# Altium schematic sheet ec200u.SchDoc
size 635 x 398 mm; SheetNumber: 3; SheetTotal: 5
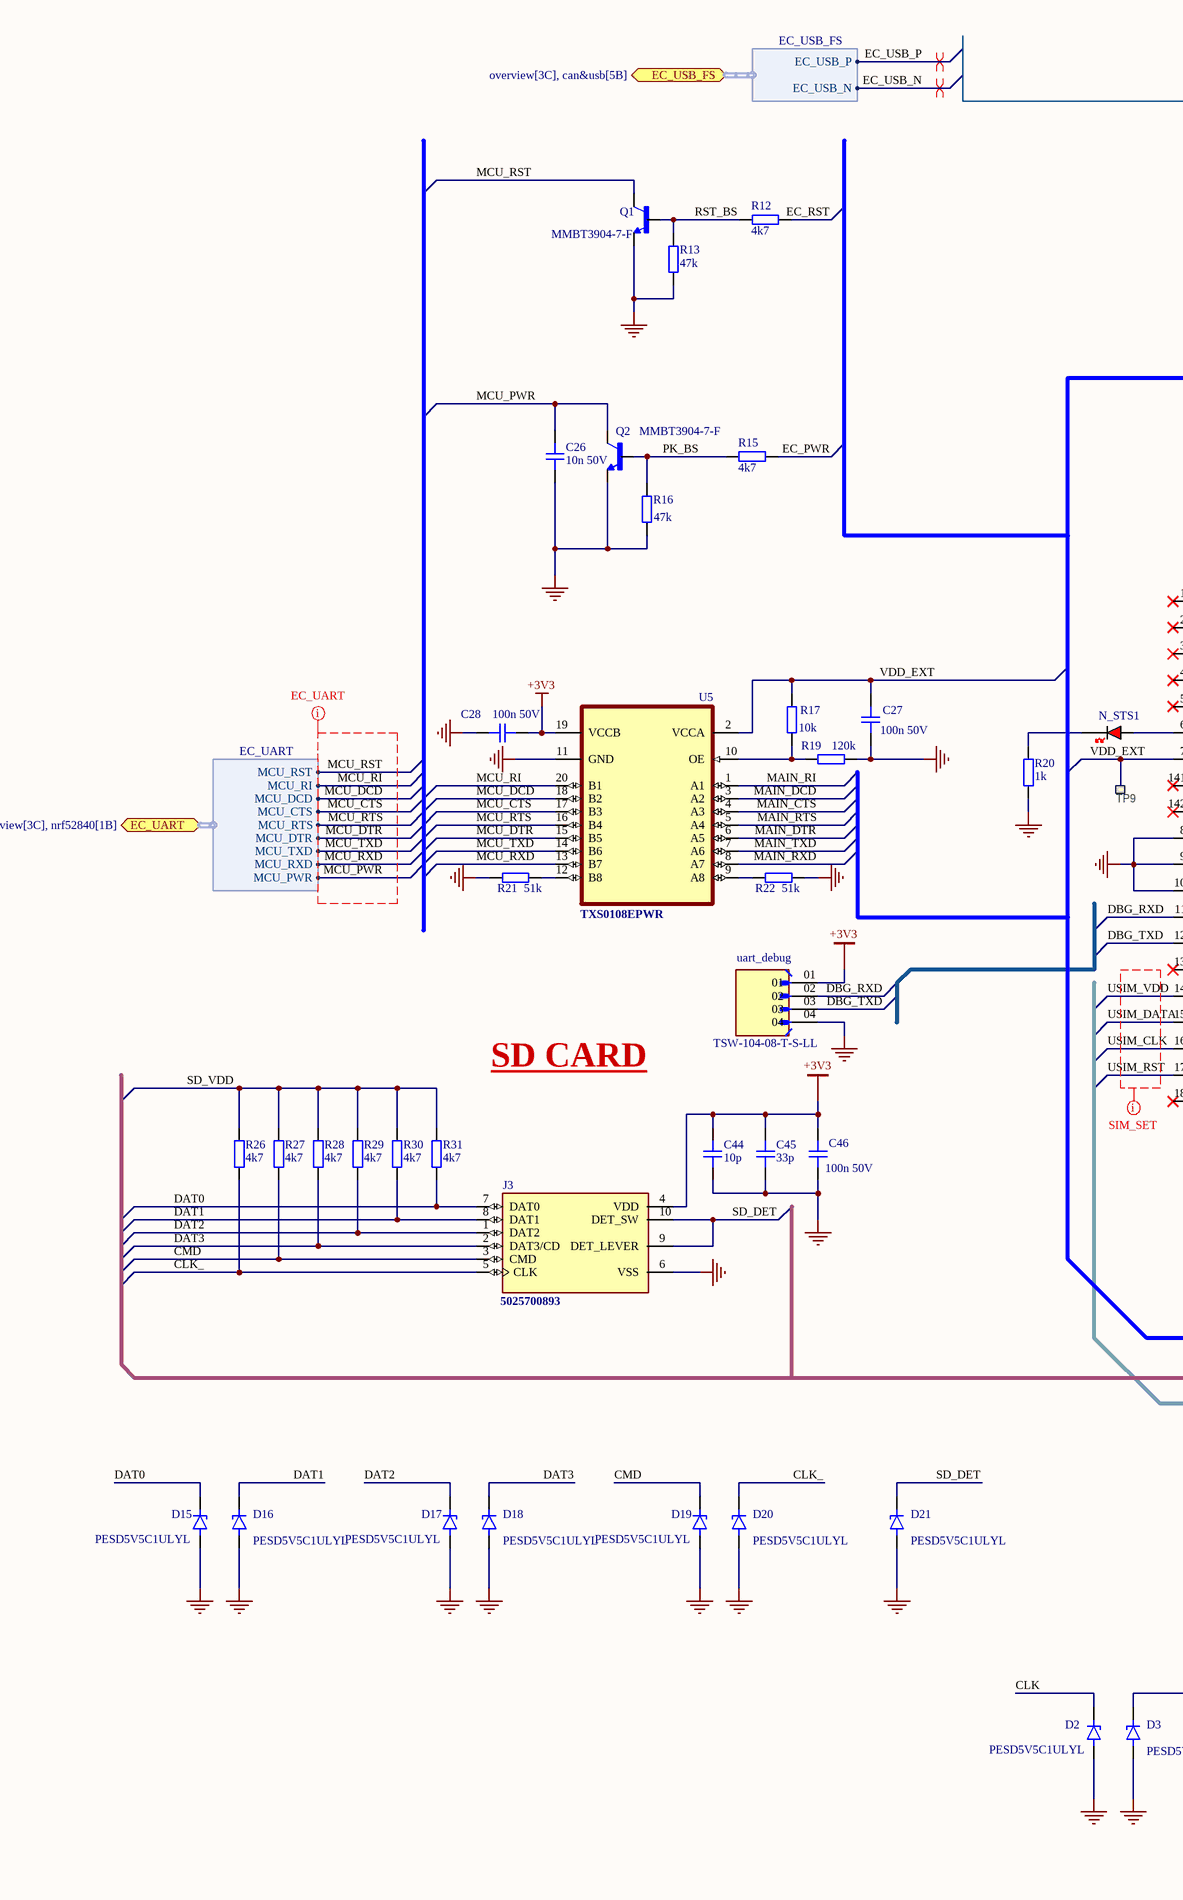
[diagram p0: ec200u.SchDoc, left]
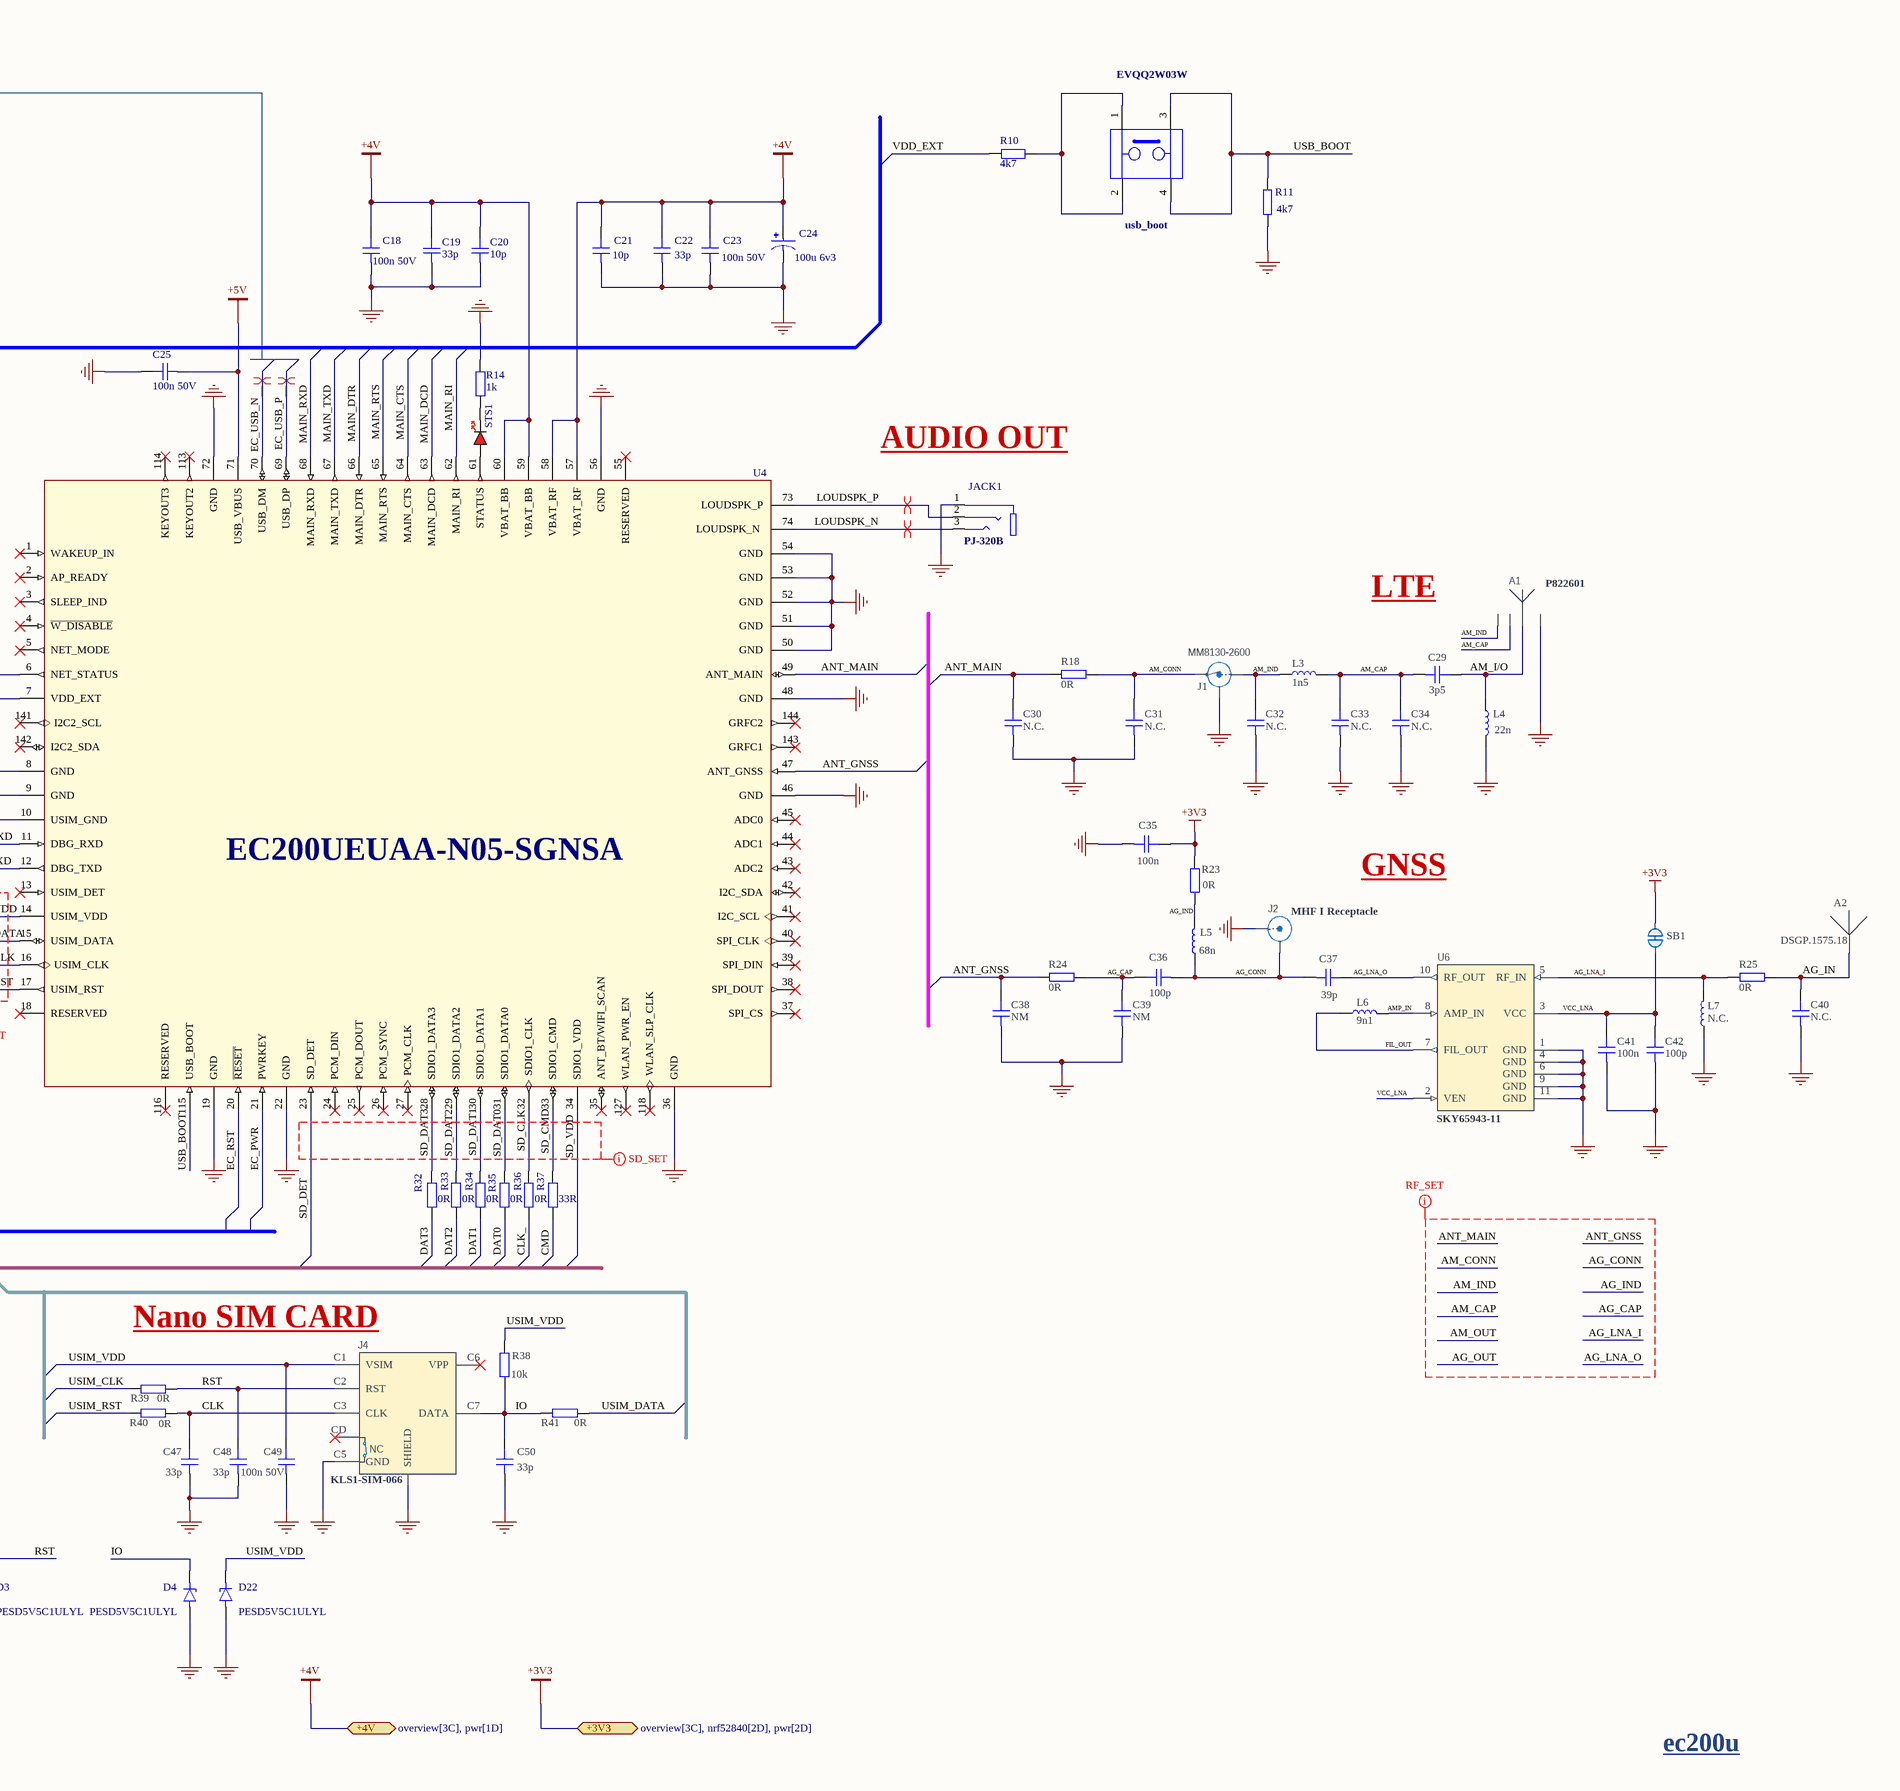
[diagram p1: ec200u.SchDoc, right]

## Parts
A1  P822601  [P822601]
A2  DSGP.1575.18  [DSGP.1575.18.4.C.02]
C18  100n 50V  [CAP_0402]
C19  33p  [CAP_0402]
C20  10p  [CAP_0402]
C21  10p  [CAP_0402]
C22  33p  [CAP_0402]
C23  100n 50V  [CAP_0402]
C24  100u 6v3  [CAP_EEEHA0J101WR]
C25  100n 50V  [CAP_0402]
C26  10n 50V  [CAP_0603]
C27  100n 50V  [CAP_0402]
C28  100n 50V  [CAP_0402]
C29  3p5  [CAPC0603X03L_C]
C30  N.C.  [CAPC1005X04L_NC]
C31  N.C.  [CAPC1005X04L_NC]
C32  N.C.  [CAPC0603X03L_C_NC]
C33  N.C.  [CAPC0603X03L_C_NC]
C34  N.C.  [CAPC0603X03L_C_NC]
C35  100n  [CAPC1005X04L]
C36  100p  [CAPC1005X04L]
C37  39p  [CAPC0603X03L_C]
C38  NM  [CAPC1005X04L]
C39  NM  [CAPC1005X04L]
C40  N.C.  [CAPC1005X04L_NC]
C41  100n  [CAPC1005X04L]
C42  100p  [CAPC1005X04L]
C44  10p  [CAP_0402]
C45  33p  [CAP_0402]
C46  100n 50V  [CAP_0402]
C47  33p  [CAPC1005X04L]
C48  33p  [CAPC1005X04L]
C49  100n 50V  [CAPC1005X04L]
C50  33p  [CAPC1005X04L]
D2  PESD5V5C1ULYL  [DIO_PESD5V5C1ULYL]
D3  PESD5V5C1ULYL  [DIO_PESD5V5C1ULYL]
D4  PESD5V5C1ULYL  [DIO_PESD5V5C1ULYL]
D15  PESD5V5C1ULYL  [DIO_PESD5V5C1ULYL]
D16  PESD5V5C1ULYL  [DIO_PESD5V5C1ULYL]
D17  PESD5V5C1ULYL  [DIO_PESD5V5C1ULYL]
D18  PESD5V5C1ULYL  [DIO_PESD5V5C1ULYL]
D19  PESD5V5C1ULYL  [DIO_PESD5V5C1ULYL]
D20  PESD5V5C1ULYL  [DIO_PESD5V5C1ULYL]
D21  PESD5V5C1ULYL  [DIO_PESD5V5C1ULYL]
D22  PESD5V5C1ULYL  [DIO_PESD5V5C1ULYL]
J1  MM8130-2600  [COAXIAL-SWF]
J2  MHF I Receptacle  [COAXIAL RF U.FL-R-SMT-1]
J3  5025700893  [MOLEX_5025700893]
J4  KLS1-SIM-066  [KLS1-SIM-066]
JACK1  PJ-320B  [BOOMELE_PJ-320B]
L3  1n5  [INDC0603X03L_C]
L4  22n  [INDC0603X03L_C]
L5  68n  [INDC1005X04L_WW]
L6  9n1  [INDC1005X04L_WW]
L7  N.C.  [INDC1005X04L_NC]
N_STS1  RED  [LED_0603_RED]  (value not drawn)
Q1  MMBT3904-7-F  [SOT95P230X110-3N]
Q2  MMBT3904-7-F  [SOT95P230X110-3N]
R10  4k7  [RES_0603]
R11  4k7  [RES_0603]
R12  4k7  [RES_0603]
R13  47k  [RES_0603]
R14  1k  [RES_0603]
R15  4k7  [RES_0603]
R16  47k  [RES_0603]
R17  10k  [RES_0603]
R18  0R  [RESC1005X04L]
R19  120k  [RES_0603]
R20  1k  [RES_0603]
R21  51k  [RES_0603]
R22  51k  [RES_0603]
R23  0R  [RESC1005X04L]
R24  0R  [RESC1005X04L]
R25  0R  [RESC1005X04L]
R26  4k7  [RES_0603]
R27  4k7  [RES_0603]
R28  4k7  [RES_0603]
R29  4k7  [RES_0603]
R30  4k7  [RES_0603]
R31  4k7  [RES_0603]
R32  0R  [RES_0603]
R33  0R  [RES_0603]
R34  0R  [RES_0603]
R35  0R  [RES_0603]
R36  0R  [RES_0603]
R37  33R  [RES_0603]
R38  10k  [RESC1005X04L]
R39  0R  [RESC1005X04L]
R40  0R  [RESC1005X04L]
R41  0R  [RESC1005X04L]
SB1  Solderbridge  [Solderbridge_Shorted]  (value not drawn)  (net tie, no BOM)
STS1  RED  [LED_0603_RED]  (value not drawn)
TP9  Ø1.0mm,SMD  [TP_SMD_D1.0mm]  (value not drawn)  (no BOM)
U4  EC200UEUAA-N05-SGNSA  [XCVR_EC200UCNAA-N05-SGNSA]
U5  TXS0108EPWR  [SOP65P640X120-20N]
U6  SKY65943-11  [SKY65943-11]
uart_debug  TSW-104-08-T-S-LL  [SAMTEC_TSW-104-08-T-S-LL]
usb_boot  EVQQ2W03W  [EVQQ2W03W]

## Ports
+3V3 (bidir, see overview[3C], nrf52840[2D], pwr[2D]), +4V (bidir, see overview[3C], pwr[1D]), EC_UART (bidir, harness EC_UART, see overview[3C], nrf52840[1B]), EC_USB_FS (bidir, harness EC_USB_FS, see overview[3C], can&usb[5B])

## Harnesses
EC_UART: MCU_RI, MCU_DCD, MCU_CTS, MCU_RTS, MCU_DTR, MCU_TXD, MCU_RXD, MCU_RST, MCU_PWR
EC_USB_FS: EC_USB_N, EC_USB_P

## Nets
+3V3: C28.2 C35.2 C44.2 C45.2 C46.2 J3.4(VDD) R23.2 SB1.1 U5.19(VCCB) uart_debug.01 ; port +3V3
+4V: C18.2 C19.2 C20.2 C21.2 C22.2 C23.2 C24.1 U4.57(VBAT_RF) U4.58(VBAT_RF) U4.59(VBAT_BB) U4.60(VBAT_BB) ; port +4V
+5V: C25.1 U4.71(USB_VBUS)
GND: A1.2 A2.2(GND) C18.1 C19.1 C20.1 C21.1 C22.1 C23.1 C24.2 C25.2 C26.1 C27.2 C28.1 C30.1 C31.1 C32.1 C33.1 C34.1 C35.1 C38.1 C39.1 C40.1 C41.1 C42.1 C44.1 C45.1 C46.1 C47.1 C48.1 C49.1 C50.1 D2.A D3.A D4.A D15.A D16.A D17.A D18.A D19.A D20.A D21.A D22.A J1.2(Shield) J2.1(X) J3.6(VSS) J4.0(SHIELD) J4.C5(GND) JACK1.1(SLEEVE) L4.2 L7.1 Q1.E Q2.E R11.1 R13.1 R14.1 R16.1 R19.1 R20.2 R21.2 R22.1 U4.8(GND) U4.9(GND) U4.10(USIM_GND) U4.19(GND) U4.22(GND) U4.36(GND) U4.46(GND) U4.48(GND) U4.50(GND) U4.51(GND) U4.52(GND) U4.53(GND) U4.54(GND) U4.56(GND) U4.72(GND) U5.11(GND) U6.1(GND) U6.4(GND) U6.6(GND) U6.9(GND) U6.11(GND) uart_debug.04
AG_CAP: C36.2 C39.2 R24.1
AG_CONN: C36.1 C37.1 J2.2(Y) L5.1
AG_IN: A2.1 C40.2 R25.2
AG_IND: L5.2 R23.1
AG_LNA_I: L7.2 R25.1 U6.5(RF_IN)
AG_LNA_O: C37.2 U6.10(RF_OUT)
AM_CAP: A1.3 C29.1 C33.2 C34.2 L3.2
AM_CONN: C31.2 J1.3(OUT) R18.2
AM_I/O: A1.1 C29.2 L4.1
AM_IND: A1.4 C32.2 J1.1(IN) L3.1
AMP_IN: L6.2 U6.8(AMP_IN)
ANT_GNSS: C38.2 R24.2 U4.47(ANT_GNSS)
ANT_MAIN: C30.2 R18.1 U4.49(ANT_MAIN)
CLK: C47.2 D2.K J4.C3(CLK) R40.2
CLK_: D20.K J3.5(CLK) R26.1 R36.2
CMD: D19.K J3.3(CMD) R27.1 R37.2
DAT0: D15.K J3.7(DAT0) R31.1 R35.2
DAT1: D16.K J3.8(DAT1) R30.1 R34.2
DAT2: D17.K J3.1(DAT2) R29.1 R33.2
DAT3: D18.K J3.2(DAT3/CD) R28.1 R32.2
DBG_RXD: U4.11(DBG_RXD) uart_debug.02
DBG_TXD: U4.12(DBG_TXD) uart_debug.03
EC_PWR: R15.1 U4.21(PWRKEY)
EC_RST: R12.1 U4.20(~{RESET})
EC_USB_N: U4.70(USB_DM) ; port EC_USB_FS.EC_USB_N
EC_USB_P: U4.69(USB_DP) ; port EC_USB_FS.EC_USB_P
FIL_OUT: L6.1 U6.7(FIL_OUT)
IO: C50.2 D4.K J4.C7(DATA) R38.1 R41.1
LOUDSPK_N: JACK1.3(TIP) U4.74(LOUDSPK_N)
LOUDSPK_P: JACK1.2(RING) U4.73(LOUDSPK_P)
MAIN_CTS: U4.64(MAIN_CTS) U5.4(A3)
MAIN_DCD: U4.63(MAIN_DCD) U5.3(A2)
MAIN_DTR: U4.66(MAIN_DTR) U5.6(A5)
MAIN_RI: U4.62(MAIN_RI) U5.1(A1)
MAIN_RTS: U4.65(MAIN_RTS) U5.5(A4)
MAIN_RXD: U4.68(MAIN_RXD) U5.8(A7)
MAIN_TXD: U4.67(MAIN_TXD) U5.7(A6)
MCU_CTS: U5.17(B3) ; port EC_UART.MCU_CTS
MCU_DCD: U5.18(B2) ; port EC_UART.MCU_DCD
MCU_DTR: U5.15(B5) ; port EC_UART.MCU_DTR
MCU_PWR: C26.2 Q2.C ; port EC_UART.MCU_PWR
MCU_RI: U5.20(B1) ; port EC_UART.MCU_RI
MCU_RST: Q1.C ; port EC_UART.MCU_RST
MCU_RTS: U5.16(B4) ; port EC_UART.MCU_RTS
MCU_RXD: U5.13(B7) ; port EC_UART.MCU_RXD
MCU_TXD: U5.14(B6) ; port EC_UART.MCU_TXD
PK_BS: Q2.B R15.2 R16.2
RST: C48.2 D3.K J4.C2(RST) R39.2
RST_BS: Q1.B R12.2 R13.2
SD_CLK: R36.1 U4.32(SDIO1_CLK)
SD_CMD: R37.1 U4.33(SDIO1_CMD)
SD_DAT0: R35.1 U4.31(SDIO1_DATA0)
SD_DAT1: R34.1 U4.30(SDIO1_DATA1)
SD_DAT2: R33.1 U4.29(SDIO1_DATA2)
SD_DAT3: R32.1 U4.28(SDIO1_DATA3)
SD_DET: D21.K J3.9(DET_LEVER) J3.10(DET_SW) U4.23(SD_DET)
SD_VDD: R26.2 R27.2 R28.2 R29.2 R30.2 R31.2 U4.34(SDIO1_VDD)
USB_BOOT: R11.2 U4.115(USB_BOOT) usb_boot.3 usb_boot.4
USIM_CLK: R39.1 U4.16(USIM_CLK)
USIM_DATA: R41.2 U4.15(USIM_DATA)
USIM_RST: R40.1 U4.17(USIM_RST)
USIM_VDD: C49.2 D22.K J4.C1(VSIM) R38.2 U4.14(USIM_VDD)
VCC_LNA: C41.2 C42.2 SB1.2 U6.2(VEN) U6.3(VCC)
VDD_EXT: C27.1 R10.1 R17.2 TP9.1 U4.7(VDD_EXT) U5.2(VCCA)
NetN_STS1_A: N_STS1.A U4.6(NET_STATUS)
NetN_STS1_K: N_STS1.K R20.1
NetR10_2: R10.2 usb_boot.1 usb_boot.2
NetR14_2: R14.2 STS1.K
NetR17_1: R17.1 R19.2 U5.10(OE)
NetR21_1: R21.1 U5.12(B8)
NetR22_2: R22.2 U5.9(A8)
NetSTS1_A: STS1.A U4.61(STATUS)

Not connected (* = marked no-connect by the designer): J4 C6(VPP)* CD*; U4 1(WAKEUP_IN)* 2(AP_READY)* 3(SLEEP_IND)* 4(~{W_DISABLE})* 5(NET_MODE)* 13(USIM_DET)* 18(RESERVED)* 24(PCM_DIN)* 25(PCM_DOUT)* 26(PCM_SYNC)* 27(PCM_CLK)* 35(ANT_BT/WIFI_SCAN)* 37(SPI_CS)* 38(SPI_DOUT)* 39(SPI_DIN)* 40(SPI_CLK)* 41(I2C_SCL)* 42(I2C_SDA)* 43(ADC2)* 44(ADC1)* 45(ADC0)* 55(RESERVED)* 113(KEYOUT2)* 114(KEYOUT3)* 116(RESERVED)* 118(WLAN_SLP_CLK)* 127(WLAN_PWR_EN)* 141(I2C2_SCL)* 142(I2C2_SDA)* 143(GRFC1)* 144(GRFC2)*

## Layout directives
differential pair: EC_USB_N, EC_USB_P, LOUDSPK_N, LOUDSPK_P
net class EC_UART: MCU_CTS, MCU_DCD, MCU_DTR, MCU_PWR, MCU_RI, MCU_RST, MCU_RTS, MCU_RXD, MCU_TXD
net class RF_SET: AG_CAP, AG_CONN, AG_IND, AG_LNA_I, AG_LNA_O, AG_OUT, AM_CAP, AM_CONN, AM_IND, AM_OUT, ANT_GNSS, ANT_MAIN
net class SD_SET: SD_CLK, SD_CMD, SD_DAT0, SD_DAT1, SD_DAT2, SD_DAT3, SD_VDD
net class SIM_SET: (no net found under the mark)

## Notes on the sheet
- AUDIO OUT
- LTE
- GNSS
- SD CARD
- (near J4) Nano SIM CARD
- ec200u
- (in symbol L-KLS1-SIM-066-(6+1)P-H1.37-R) NC

## Library data of the parts
A1 = P822601_1: ANTENNA PRESTTA OCTABAND LTE; Manufacturer: Ethertronics; Part number IPS: 00000009001; Part number NEMS: 100700043; Note: N.A.; Pad Count: 2; Component Status: Active; Part Number: P822601; Manufacturer Part Number: P822601; Footprint Doc: P822601; LatestRevisionDate: 2017-07-28; Published: 2017-07-28; Value: P822601; Artikkelnr Noca: N.A.; ComponentLink1URL: N.A.; ComponentLink1Description: Datasheet; ComponentLink2URL: N.A.; ComponentLink2Description: Supplier link; HelpURL: http://www.ethertronics.com/wp-content/uploads/2016/11/Prestta-P822601-P822602-Standard-Cellular-Octa-Band-20160904.pdf; Supplier 1: moreelectronics.dk; Supplier Part Number 1: P822601; Supplier 2: Digi-Key; Supplier Part Number 2: 939-1057-1-ND; PartId: 100700043; Component Class: Antennas; Author: rsk; Part number Norautron: N.A.
A2 = DSGP.1575.18.4.C.02: 18 x 18 mm Low Profile GPS L1 / GALILEO E1 Passive Patch Antenna; Manufacturer: Taoglas; Part number IPS: 00000007687; Part number NEMS: 100700073; Note: N.A.; Pad Count: 2; Component Status: Active; Part Number: DSGP.1575.18.4.C.02; Manufacturer Part Number: DSGP.1575.18.4.C.02; ComponentLink1URL: https://www.taoglas.com/datasheets/DSGP.1575.18.4.A.02.pdf; ComponentLink1Description: Datasheet; ComponentLink2URL: https://www.digikey.com/product-detail/en/taoglas-limited/DSGP.1575.18.4.A.02/931-1511-1-ND/8275289; ComponentLink2Description: Supplier link; HelpURL: https://www.taoglas.com/product/18184mm-dsgp-1575-184-gps-l1-galileo-e1-ceramic-patch-copy/?compare=16929; Footprint Doc: DSGP.1575.18.4.C.02; LatestRevisionDate: 2023-01-01; Published: 2022-01-13; Value: DSGP.1575.18; Supplier 1: N.A.; Supplier Part Number 1: N.A.; Supplier 2: N.A.; Supplier Part Number 2: N.A.; Artikkelnr Noca: N.A.; Component Class: Antennas; Author: rubr; Part number Norautron: N.A.; PartId: 100700073
C18 C23 C25 C27 C28 C46 = CAP_0402: Capacitor SMD 0402; Manufacturer: Murata Electronics; MPN: GRM155R71H104KE14D; Distributor Link: *; LCSC NO: C77020; Rating: *; Dielectric: *; ComponentLink1Description: LCSC Link; ComponentLink1URL: https://lcsc.com/product-detail/Multilayer-Ceramic-Capacitors-MLCC-SMD-SMT_Murata-Electronics-GRM155R71H104KE14D_C77020.html?s_z=n_100nF
C19-C22 C44 C45 = CAP_0402: Capacitor SMD 0402; Manufacturer: *; Manufacturer Part Number: *; Distributor Link: *; LCSC: *; Rating: *; Dielectric: *
C24 = EEEHA0J101WR: CAPACITOR ALUM ELEC, 100UF, 20%, 6.3V, S; CAPACITOR ALUM ELEC, 100UF, 20%, 6.3V, SMD; Product Range:PANASONIC - HA Series; Capacitance:100ÂµF; Capacitance Tolerance:Â± 20%; Voltage Rating:6.3V; Capacitor Case Style:Radial Can - SMD; Diameter:5mm; Height:5.4mm; Series:HA; MF: Panasonic Electronic; MP: EEE-HA0J101WR; Availability: In Stock; Check_prices: https://www.snapeda.com/parts/EEE-HA0J101WR/Panasonic%20Electronic%20Components/view-part/2733110/?ref=eda; SnapEDA_Link: https://www.snapeda.com/parts/EEE-HA0J101WR/Panasonic%20Electronic%20Components/view-part/2733110/?ref=snap; Purchase-URL: https://pricing.snapeda.com/search/part/EEE-HA0J101WR/?ref=eda; Package: RADIAL-2 Panasonic; Value: *; Price: None
C26 = CAP_0603: Capacitor SMD 0603; Manufacturer: *; Manufacturer Part Number: *; Distributor Link: *; LCSC: *; Rating: *; Dielectric: *
C29 = C0201-3.5p: Capacitor, NP0, ±0.1pF, 25V; Manufacturer: Murata; Manufacturer Part Number: GJM0335C1H3R5BB01E; Part number IPS: 00000001469; Part number NEMS: 100200023; Value: 3.5pF; Artikkelnr Noca: N.A.; Pad Count: 2; Component Status: Active; Part Number: C0201-3.5p; ComponentLink1URL: N.A.; ComponentLink1Description: Datasheet; ComponentLink2URL: N.A.; ComponentLink2Description: Supplier link; HelpURL: N.A.; Footprint Doc: 0201; LatestRevisionDate: 2019-02-22; Published: 2019-02-22; Note: 25V; Supplier 1: N.A.; Supplier Part Number 1: N.A.; Supplier 2: N.A.; Supplier Part Number 2: N.A.; PartId: 100200023; Component Class: Capacitors; Author: rsk; Part number Norautron: N.A.
C30 C31 C40 = C0402-N.C.: Not mounted; Manufacturer: N.A.; Part number NEMS: 100200105; Assembly: Not mounted; Note: Chip Cap; Pad Count: 2; Component Status: Active; Part Number: C0402-N.C.; Manufacturer Part Number: N.A.; ComponentLink1URL: N.A.; ComponentLink1Description: Datasheet; ComponentLink2URL: N.A.; ComponentLink2Description: Supplier link; HelpURL: N.A.; Footprint Doc: 0402; LatestRevisionDate: 2009-05-08; Published: 2009-05-08; Value: N.C.; Supplier 1: N.A.; Supplier Part Number 1: N.A.; Supplier 2: N.A.; Supplier Part Number 2: N.A.; Artikkelnr Noca: N.A.; Part number IPS: N.A.; PartId: 100200105; Component Class: Capacitors; Author: rsk; Part number Norautron: N.A.
C32-C34 = C0201-N.C.: Not mounted; Manufacturer: N.A.; Part number NEMS: 100200001; Note: Chip Cap; Assembly: Not mounted; Pad Count: 2; Component Status: Active; Part Number: C0201-N.C.; Manufacturer Part Number: N.A.; ComponentLink1URL: N.A.; ComponentLink1Description: Datasheet; ComponentLink2URL: N.A.; ComponentLink2Description: Supplier link; HelpURL: N.A.; Footprint Doc: 0201; LatestRevisionDate: 2014-11-13; Published: 2014-11-13; Value: N.C.; Artikkelnr Noca: N.A.; Part number IPS: N.A.; Supplier 1: N.A.; Supplier Part Number 1: N.A.; Supplier 2: N.A.; Supplier Part Number 2: N.A.; PartId: 100200001; Component Class: Capacitors; Author: rsk; Part number Norautron: N.A.
C35 C36 C38 C39 C41 C42 C47-C50 = C0402-4µ7: Capacitor, X5R, ±20%; Manufacturer: N.A.; Part number IPS: 00000001251, 00000007165; Part number NEMS: 100200193; Value: 4.7µF; Note: 10V; Artikkelnr Noca: 20039482; Pad Count: 2; Component Status: Active; Part Number: C0402-4µ7; Manufacturer Part Number: N.A.; ComponentLink1URL: N.A.; ComponentLink1Description: Datasheet; ComponentLink2URL: N.A.; ComponentLink2Description: Supplier link; HelpURL: N.A.; Footprint Doc: 0402; LatestRevisionDate: 2017-11-09; Published: 2009-05-08; Supplier 1: Digi-Key; Supplier Part Number 1: 490-13252-1-ND; Supplier 2: N.A.; Supplier Part Number 2: N.A.; PartId: 100200193; Component Class: Capacitors; Author: rsk; Part number Norautron: N.A.
C37 = C0201-39p: Capacitor, NP0, ±1%, 25V; Manufacturer: Murata; Manufacturer Part Number: GRM0335C1E390FA01; Part number IPS: 00000001668; Part number NEMS: 100200039; Value: 39pF; Artikkelnr Noca: N.A.; Pad Count: 2; Component Status: Active; Part Number: C0201-39p; ComponentLink1URL: N.A.; ComponentLink1Description: Datasheet; ComponentLink2URL: N.A.; ComponentLink2Description: Supplier link; HelpURL: N.A.; Footprint Doc: 0201; LatestRevisionDate: 2019-04-16; Published: 2019-04-16; Note: 25V; Supplier 1: N.A.; Supplier Part Number 1: N.A.; Supplier 2: N.A.; Supplier Part Number 2: N.A.; PartId: 100200039; Component Class: Capacitors; Author: rsk; Part number Norautron: N.A.
D2-D4 D15-D22 = PESD5V5C1ULYL: Esd Protection Device, 5.5V, Dfn1006 Rohs Compliant: Yes |Nexperia PESD5V5C1ULYL; MF: Nexperia USA Inc.; SnapEDA_Link: https://www.snapeda.com/parts/PESD5V5C1ULYL/Nexperia/view-part/?ref=snap; Package: SOD-882 Nexperia USA; Value: *; MP: PESD5V5C1ULYL; Check_prices: https://www.snapeda.com/parts/PESD5V5C1ULYL/Nexperia/view-part/?ref=eda
J1 = MM8130-2600: Coaxial Connector with Switch; Manufacturer: Murata; Part number IPS: 00000009955; Part number Norautron: 26030338; Part number NEMS: 100500400; Note: N.A.; Artikkelnr Noca: 55029011; Pad Count: 3; Component Status: Active; Part Number: MM8130-2600; Manufacturer Part Number: MM8130-2600; LatestRevisionDate: 2014-04-24; Published: 2014-04-24; Value: MM8130-2600; Footprint Doc: COAXIAL-SWF; ComponentLink1URL: N.A.; ComponentLink1Description: Datasheet; ComponentLink2URL: N.A.; ComponentLink2Description: Supplier link; HelpURL: http://www.murata.com/products/catalog/pdf/o33e.pdf; Supplier 1: Digi-Key; Supplier Part Number 1: 490-4981-1-ND; Supplier 2: Mouser; Supplier Part Number 2: 81-MM8130-2600RA2; PartId: 100500400; Component Class: Connectors; Author: rsk; System: Connector
J2 = 20279-001E-03: Ultraminiature Coaxial Connector, 50 Ohm, SMD; Manufacturer: Wellshow; Part number IPS: 00000004436; Part number NEMS: 100500636; Note: N.A.; Pad Count: 3; Component Status: Active; Part Number: 20279-001E-03; Manufacturer Part Number: 20279-001E-03; ComponentLink1URL: \\hizz\pro\app9717\Datasheet\connectors\Wellshow\20279C18.pdf; ComponentLink1Description: Datasheet; ComponentLink2URL: N.A.; ComponentLink2Description: Supplier link; HelpURL: N.A.; Footprint Doc: COAXIAL RF MHFI; LatestRevisionDate: 2020-04-28; Published: 2020-01-07; Value: MHF I Receptacle; Supplier 1: Cabcon; Supplier Part Number 1: 20279-001E-03; Supplier 2: Digi-Key; Supplier Part Number 2: H11891DKR-ND; Artikkelnr Noca: N.A.; PartId: 100500636; Component Class: Connectors; Author: rsk; Part number Norautron: N.A.; System: Connector
J3 = 5025700893: 10 _8 + 2_ Position Card Connector Secure Digital - microSDâ„¢ Surface Mount, Right Angle Gold; MF: Molex; MP: 5025700893; Value: *; SnapEDA_Link: https://www.snapeda.com/parts/5025700893/Molex/view-part/379523/?ref=snap; Package: None; Availability: Unavailable; Price: None
J4 = L-KLS1-SIM-066-(6+1)P-H1.37-R: Nano SIM Card Connector, Push-Push, 6-Pin, H1.37mm, with CD Pin; Manufacturer: KLS Electronic; Part number NEMS: 100500776; Note: N.A.; Pad Count: 7; Component Status: Active; Part Number: L-KLS1-SIM-066-(6+1)P-H1.37-R; Manufacturer Part Number: L-KLS1-SIM-066-(6+1)P-H1.37-R; Footprint Doc: KLS1-SIM-066; LatestRevisionDate: 2023-01-01; Published: 2023-01-01; Value: KLS1-SIM-066; Artikkelnr Noca: N.A.; Part number IPS: N.A.; ComponentLink1URL: https://klsele.com/admin/product_upload/20190123133741L-KLS1-SIM-066-(6+1)P-H1.37-R--.pdf; ComponentLink1Description: Datasheet; ComponentLink2URL: N.A.; ComponentLink2Description: Supplier link; HelpURL: https://klsele.com/products/connectors/SIM-card-connectors-Micro-SIM-card-connectors-Nano-SIM-Card-Connectors/4918.html; Supplier 1: Cabcon; Supplier Part Number 1: L-KLS1-SIM-066-(6+1)P-H1.37-R; Supplier 2: N.A.; Supplier Part Number 2: N.A.; Component Class: Connectors; Author: rubr; Part number Norautron: N.A.; System: Connector; PartId: 100500776
JACK1 = PJ-320B: 3.5mm Headphone Jack SMD; MF: Luoyang Dishang electronics; LCSC: https://lcsc.com/product-detail/Audio-Connectors_BOOMELE-Boom-Precision-Elec-PJ-320B_C18594.html?s_z=n_PJ320B; MP: PJ-320B; LCSC NO: C18594
L3 = L0201-1n5-HQ-Murata: Inductor, 1000mA, ±0.1ｎH, 50mOhm; Manufacturer: Murata; Manufacturer Part Number: LQP03HQ1N5B02; Part number NEMS: 100300202; Value: 1.5nH; Note: -55°C ~ 125°C; Artikkelnr Noca: N.A.; Pad Count: 2; Component Status: Active; Part Number: L0201-1n5-HQ-Murata; ComponentLink1URL: https://search.murata.co.jp/Ceramy/image/img/P02/JELF243C-0021.pdf; ComponentLink1Description: Datasheet; ComponentLink2Description: Supplier link; HelpURL: https://psearch.en.murata.com/inductor/product/LQP03HQ1N5B02%23.html; Footprint Doc: 0201; LatestRevisionDate: 2018-10-23; Published: 2018-10-23; Part number IPS: N.A.; ComponentLink2URL: N.A.; Supplier 1: Digi-Key; Supplier Part Number 1: 490-13881-1-ND; Supplier 2: N.A.; Supplier Part Number 2: N.A.; PartId: 100300202; Component Class: Inductors; Author: rsk; Part number Norautron: N.A.
L4 = L0201-22n: Chip Inductor; Manufacturer: N.A.; Part number IPS: 00000001478; Part number NEMS: 100300034; Value: 22nH; Note: High frequency chip inductor ±10%; Pad Count: 2; Component Status: Active; Part Number: L0201-22n; Manufacturer Part Number: N.A.; ComponentLink1URL: N.A.; ComponentLink1Description: Datasheet; ComponentLink2Description: Supplier link; HelpURL: N.A.; Footprint Doc: 0201; LatestRevisionDate: 2019-08-29; Published: 2013-04-10; Artikkelnr Noca: N.A.; ComponentLink2URL: N.A.; Supplier 1: N.A.; Supplier Part Number 1: N.A.; Supplier 2: N.A.; Supplier Part Number 2: N.A.; PartId: 100300034; Component Class: Inductors; Author: rsk; Part number Norautron: N.A.
L5 = L0402-68n-Wirewound-Murata: Inductor, 140mA, ±2%, 1960mΩ, Q=20; Manufacturer: Murata; Manufacturer Part Number: LQW15AN68NG00; Part number IPS: 00000002494; Part number NEMS: 100300389; Value: 68nH; Note: -55°C ~ 125°C; Artikkelnr Noca: N.A.; Pad Count: 2; Component Status: Active; Part Number: L0402-68n-Wirewound-Murata; ComponentLink1URL: https://search.murata.co.jp/Ceramy/image/img/P02/JELF243A-0050.pdf; ComponentLink1Description: Datasheet; ComponentLink2URL: N.A.; ComponentLink2Description: Supplier link; HelpURL: https://psearch.en.murata.com/inductor/product/LQW15AN68NG00%23.html; Footprint Doc: 0402; LatestRevisionDate: 2019-04-16; Published: 2019-04-16; Supplier 1: Digi-Key; Supplier Part Number 1: 490-6837-1-ND; Supplier 2: N.A.; Supplier Part Number 2: N.A.; PartId: 100300389; Component Class: Inductors; Author: rsk; Part number Norautron: N.A.
L6 = L0402-9n1-Wirewound-Murata: Inductor, 540mA, ±2%, 140mΩ, Q=25; Manufacturer: Murata; Manufacturer Part Number: LQW15AN9N1G00; Part number IPS: 00000002497; Part number NEMS: 100300357; Value: 9.1nH; Note: -55°C ~ 125°C; Artikkelnr Noca: N.A.; Pad Count: 2; Component Status: Active; Part Number: L0402-9n1-Wirewound-Murata; ComponentLink1URL: https://search.murata.co.jp/Ceramy/image/img/P02/JELF243A-0050.pdf; ComponentLink1Description: Datasheet; ComponentLink2URL: N.A.; ComponentLink2Description: Supplier link; HelpURL: https://psearch.en.murata.com/inductor/product/LQW15AN9N1G00%23.html; Footprint Doc: 0402; LatestRevisionDate: 2019-04-16; Published: 2019-04-16; Supplier 1: Digi-Key; Supplier Part Number 1: 490-6854-1-ND; Supplier 2: N.A.; Supplier Part Number 2: N.A.; PartId: 100300357; Component Class: Inductors; Author: rsk; Part number Norautron: N.A.
L7 = L0402-N.C.: Not mounted; Manufacturer: N.A.; Part number NEMS: 100300037; Assembly: Not mounted; Pad Count: 2; Component Status: Active; Part Number: L0402-N.C.; Manufacturer Part Number: N.A.; ComponentLink1URL: N.A.; ComponentLink1Description: Datasheet; ComponentLink2URL: N.A.; ComponentLink2Description: Supplier link; HelpURL: N.A.; Footprint Doc: 0402; LatestRevisionDate: 2016-11-24; Published: 2016-11-24; Value: N.C.; Note: N.A.; Supplier 1: N.A.; Supplier Part Number 1: N.A.; Supplier 2: N.A.; Supplier Part Number 2: N.A.; Artikkelnr Noca: N.A.; Part number IPS: N.A.; PartId: 100300037; Component Class: Inductors; Author: rsk; Part number Norautron: N.A.
N_STS1 STS1 = LED_0603_RED: LED 0603 RED SMD
Q1 Q2 = MMBT3904-7-F: NPN SMALL SIGNAL SURFACE MOUNT TRANSISTOR; Package: None; Price: None; Availability: Unavailable; MP: MMBT3904-7-F; Value: *
R10-R17 R19-R22 R26-R37 = RES_0603: Resistor SMD 0603; Manufacturer: *; Manufacturer Part Number: *; Distributor Link: *; LCSC: *
R18 R23-R25 R39-R41 = R0402-0R: Resistor, ±5%, 0.063W; Manufacturer: N.A.; Part number IPS: 00000007128; Part number NEMS: 100100109; Note: Chip Res 5%; Artikkelnr Noca: 27049000; Pad Count: 2; Component Status: Active; Part Number: R0402-0R; Manufacturer Part Number: N.A.; ComponentLink1URL: N.A.; ComponentLink1Description: Datasheet; ComponentLink2URL: N.A.; ComponentLink2Description: Supplier link; HelpURL: N.A.; Footprint Doc: 0402; LatestRevisionDate: 2009-11-23; Published: 2009-05-08; Value: 0R; Supplier 1: Farnell; Supplier Part Number 1: 146-9661; Supplier 2: N.A.; Supplier Part Number 2: N.A.; PartId: 100100109; Component Class: Resistors; Author: rsk; Part number Norautron: N.A.
R38 = R0402-0R: Resistor, ±5%, 0.063W; Manufacturer: N.A.; Part number IPS: 00000007128; Part number NEMS: 100100109; Value: 0R; Note: Chip Res 5%; Artikkelnr Noca: 27049000; Pad Count: 2; Component Status: Active; Part Number: R0402-0R; Manufacturer Part Number: N.A.; ComponentLink1URL: N.A.; ComponentLink1Description: Datasheet; ComponentLink2URL: N.A.; ComponentLink2Description: Supplier link; HelpURL: N.A.; Footprint Doc: 0402; LatestRevisionDate: 2009-11-23; Published: 2009-05-08; Supplier 1: Farnell; Supplier Part Number 1: 146-9661; Supplier 2: N.A.; Supplier Part Number 2: N.A.; PartId: 100100109; Component Class: Resistors; Author: rsk; Part number Norautron: N.A.
SB1 = Solderbridge Shorted: Shorted Solderbridge; Manufacturer: N.A.; Part number NEMS: 100500459; Pad Count: 2; Component Status: Active; System: Connector; Part Number: Solderbridge Shorted; Manufacturer Part Number: N.A.; Footprint Doc: Solderbridge_Shorted; LatestRevisionDate: 2012-08-07; Published: 2012-08-07; Value: Solderbridge; Note: N.A.; Artikkelnr Noca: N.A.; Part number IPS: N.A.; ComponentLink1URL: N.A.; ComponentLink1Description: Datasheet; ComponentLink2URL: N.A.; ComponentLink2Description: Supplier link; HelpURL: N.A.; Supplier 1: N.A.; Supplier Part Number 1: N.A.; Supplier 2: N.A.; Supplier Part Number 2: N.A.; PartId: 100500459; Component Class: Connectors; Author: rsk; Part number Norautron: N.A.
TP9 = TP_SMD_Ø1.0MM: 1.0mm circular SMD testpad; Manufacturer: Nordic Semiconductor; Manufacturer Part Number: N.A.; Part number NEMS: 100500475; Pad Count: 1; Component Status: Active; Part Number: TP_SMD_Ø1.0MM; ComponentLink1URL: N.A.; ComponentLink1Description: Datasheet; ComponentLink2URL: N.A.; ComponentLink2Description: Supplier link; HelpURL: N.A.; Footprint Doc: TP_SMD_Ø1.0mm; LatestRevisionDate: 2021-03-05; Published: 2013-06-11; Value: Ø1.0mm,SMD; Note: N.A.; Artikkelnr Noca: N.A.; Part number IPS: N.A.; Supplier 1: N.A.; Supplier Part Number 1: N.A.; Supplier 2: N.A.; Supplier Part Number 2: N.A.; PartId: 100500475; Component Class: Connectors; Author: rsk; Part number Norautron: N.A.
U4 = EC200UEUAA-N05-SGNSA: Quectel 4G LTE Cat 1 wireless BT GNSS module; MP: EC200UCNAA-N05-SGNSA; SnapEDA_Link: https://www.snapeda.com/parts/EC200UCNAA-N05-SGNSA/Quectel/view-part/?ref=snap; Package: None; Value: *; MF: Quectel; Check_prices: https://www.snapeda.com/parts/EC200UCNAA-N05-SGNSA/Quectel/view-part/?ref=eda
U5 = TXS0108EPWR: 8-bit bidirectional voltage-level shifter for open-drain and push-pull application; MF: Texas Instruments; Value: *; SnapEDA_Link: https://www.snapeda.com/parts/TXS0108EPWR/Texas+Instruments/view-part/?ref=snap; Purchase-URL: https://pricing.snapeda.com/search/part/TXS0108EPWR/?ref=eda; Availability: In Stock; Price: None; Package: TSSOP-20 Texas Instruments; Check_prices: https://www.snapeda.com/parts/TXS0108EPWR/Texas+Instruments/view-part/?ref=eda; MP: TXS0108EPWR
U6 = SKY65943-11: GNSS Low-Noise Amplifier Front-End Module with Integrated Pre-Filter and Post-Filter; Manufacturer: Skyworks; Part number IPS: 00000002997; Part number NEMS: 101900584; Note: N.A.; Pad Count: 10; Component Status: Active; Part Number: SKY65943-11; Manufacturer Part Number: SKY65943-11; Footprint Doc: MCM-10; Value: SKY65943-11; ComponentLink1URL: http://www.skyworksinc.com/uploads/documents/SKY65943_11_204404F.pdf; ComponentLink1Description: Datasheet; ComponentLink2URL: https://www.digikey.com/product-detail/en/skyworks-solutions-inc/SKY65943-11/863-2032-1-ND; ComponentLink2Description: Supplier link; HelpURL: http://www.skyworksinc.com/Product/3579/SKY65943-11; LatestRevisionDate: 2019-04-16; Published: 2019-04-16; Supplier 1: Digi-Key; Supplier Part Number 1: 863-2032-1-ND; Supplier 2: Mouser; Supplier Part Number 2: 873-SKY65943-11; Artikkelnr Noca: N.A.; PartId: 101900584; Component Class: Misc_ICs; Author: rsk; Part number Norautron: N.A.
uart_debug = 4PIN_TSW-104-08-T-S-LL: MF: Samtec; Availability: Unavailable; Value: *; Package: None; Price: None; MP: TSW-104-08-T-S-LL
usb_boot = EVQQ2W03W: White Push Plate Tactile Switch, SPST-NO 20 mA 3.1mm; MF: Panasonic; Package: None; Check_prices: https://www.snapeda.com/parts/EVQQ2W03W/Panasonic/view-part/?ref=eda; SnapEDA_Link: https://www.snapeda.com/parts/EVQQ2W03W/Panasonic/view-part/?ref=snap; Price: None; Availability: In Stock; MP: EVQQ2W03W; Value: *